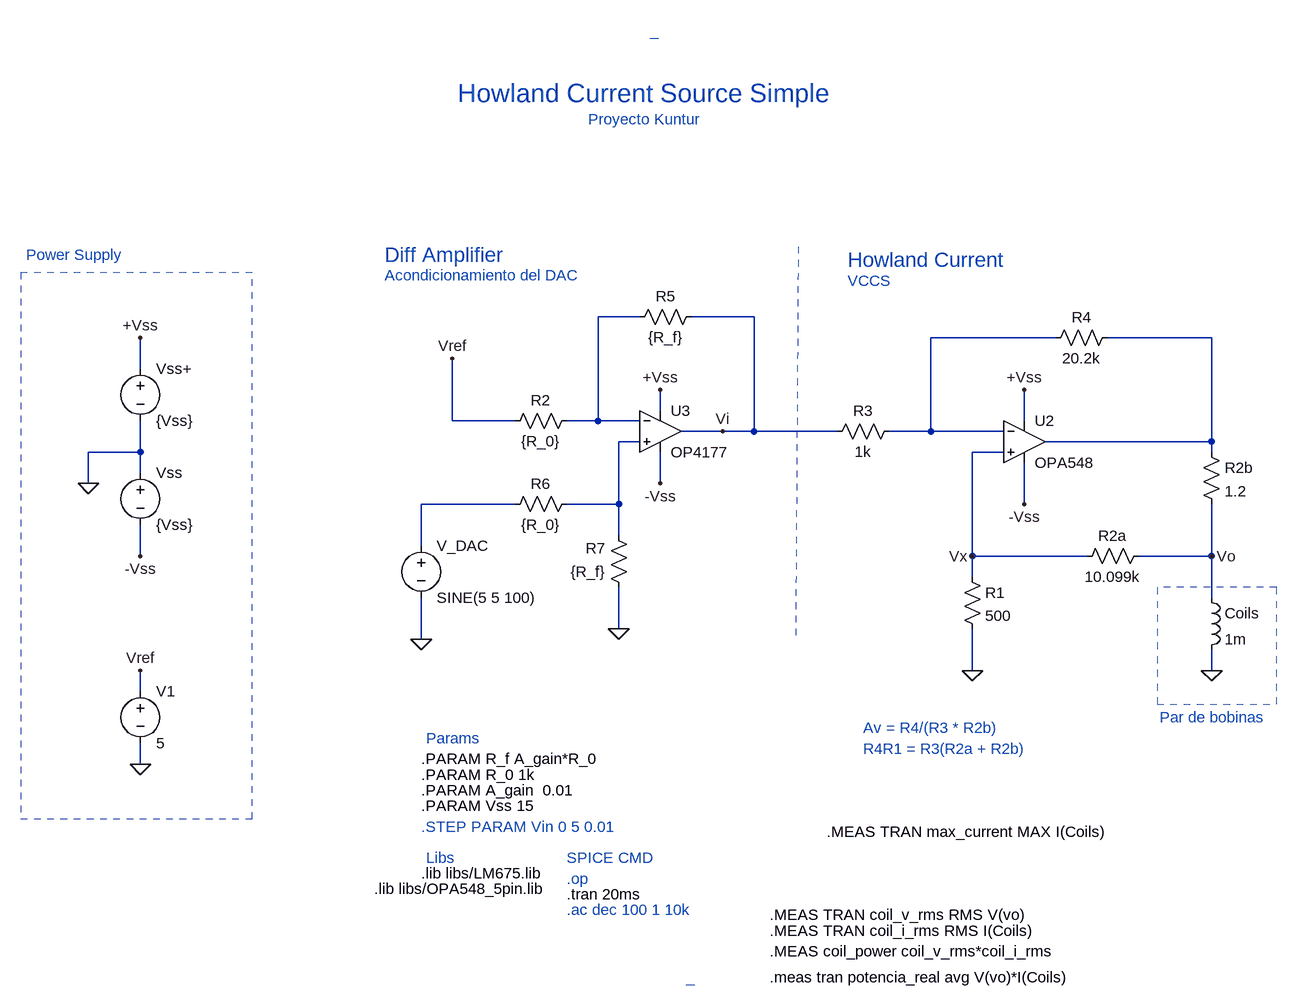
[diagram p0: schematic howland_cs.asc]
howland_cs.asc, the LTspice schematic file:
Version 4
SHEET 1 888 1144
WIRE -96 64 -160 64
WIRE 80 64 -16 64
WIRE 544 96 352 96
WIRE 784 96 624 96
WIRE -864 144 -864 96
WIRE -64 208 -64 176
WIRE -384 224 -384 128
WIRE -288 224 -384 224
WIRE -160 224 -160 64
WIRE -160 224 -208 224
WIRE -96 224 -160 224
WIRE 496 224 496 176
WIRE 32 240 -32 240
WIRE 80 240 80 64
WIRE 80 240 32 240
WIRE 208 240 80 240
WIRE 352 240 352 96
WIRE 352 240 288 240
WIRE 464 240 352 240
WIRE -96 256 -128 256
WIRE 784 256 784 96
WIRE 784 256 528 256
WIRE -864 272 -864 224
WIRE -864 272 -944 272
WIRE 464 272 416 272
WIRE 784 272 784 256
WIRE -864 304 -864 272
WIRE -944 320 -944 272
WIRE -64 320 -64 272
WIRE -288 352 -432 352
WIRE -128 352 -128 256
WIRE -128 352 -208 352
WIRE 496 352 496 288
WIRE -128 400 -128 352
WIRE -432 416 -432 352
WIRE -864 432 -864 384
WIRE 416 432 416 272
WIRE 592 432 416 432
WIRE 784 432 784 352
WIRE 784 432 672 432
WIRE 416 464 416 432
WIRE 784 496 784 432
WIRE -128 544 -128 480
WIRE -432 560 -432 496
WIRE 416 608 416 544
WIRE 784 608 784 576
WIRE -864 640 -864 608
WIRE -864 752 -864 720
FLAG -944 320 0
FLAG -864 432 -Vss
FLAG -864 96 +Vss
FLAG 496 176 +Vss
FLAG 496 352 -Vss
FLAG 416 608 0
FLAG 784 608 0
FLAG -864 752 0
FLAG -864 608 Vref
FLAG -128 544 0
FLAG -432 560 0
FLAG -384 128 Vref
FLAG -64 320 -Vss
FLAG -64 176 +Vss
FLAG 32 240 Vi
FLAG 416 432 Vx
FLAG 784 432 Vo
SYMBOL voltage -864 288 R0
SYMATTR InstName Vss
SYMATTR Value {Vss}
SYMBOL voltage -864 128 R0
SYMATTR InstName Vss+
SYMATTR Value {Vss}
SYMBOL Res 304 224 R90
WINDOW 0 0 56 VBottom 2
WINDOW 3 32 56 VTop 2
SYMATTR InstName R3
SYMATTR Value 1k
SYMBOL Res 640 80 R90
WINDOW 0 0 56 VBottom 2
WINDOW 3 32 56 VTop 2
SYMATTR InstName R4
SYMATTR Value 20.2k
SYMBOL Res 400 448 R0
SYMATTR InstName R1
SYMATTR Value 500
SYMBOL ind 768 480 R0
SYMATTR InstName Coils
SYMATTR Value 1m
SYMATTR SpiceLine Rser=10
SYMBOL Res 768 256 R0
SYMATTR InstName R2b
SYMATTR Value 1.2
SYMBOL Res 688 416 R90
WINDOW 0 0 56 VBottom 2
WINDOW 3 32 56 VTop 2
SYMATTR InstName R2a
SYMATTR Value 10.099k
SYMBOL OpAmps/opamp2 496 192 R0
SYMATTR InstName U2
SYMATTR Value OPA548
SYMATTR SpiceModel OPA548
SYMBOL Voltage -864 624 R0
SYMATTR InstName V1
SYMATTR Value 5
SYMBOL Res -192 208 R90
WINDOW 0 0 56 VBottom 2
WINDOW 3 32 56 VTop 2
SYMATTR InstName R2
SYMATTR Value {R_0}
SYMBOL Res 0 48 R90
WINDOW 0 0 56 VBottom 2
WINDOW 3 32 56 VTop 2
SYMATTR InstName R5
SYMATTR Value {R_f}
SYMBOL Res -192 336 R90
WINDOW 0 0 56 VBottom 2
WINDOW 3 32 56 VTop 2
SYMATTR InstName R6
SYMATTR Value {R_0}
SYMBOL Res -112 496 R180
WINDOW 0 36 76 Left 2
WINDOW 3 36 40 Left 2
SYMATTR InstName R7
SYMATTR Value {R_f}
SYMBOL Voltage -432 400 R0
SYMATTR InstName V_DAC
SYMATTR Value SINE(5 5 100)
SYMBOL OpAmps/OP4177 -64 176 R0
SYMATTR InstName U3
TEXT -208 928 Left 2 ;.op
TEXT -432 920 Left 2 !.lib libs/LM675.lib
TEXT -432 848 Left 2 ;.STEP PARAM Vin 0 5 0.01
TEXT -432 792 Left 2 !.PARAM A_gain  0.01
TEXT -432 768 Left 2 !.PARAM R_0 1k
TEXT -432 744 Left 2 !.PARAM R_f A_gain*R_0
TEXT -488 -32 Left 3 ;Diff Amplifier
TEXT -488 0 Left 2 ;Acondicionamiento del DAC
TEXT -88 -280 Center 4 ;Howland Current Source Simple
TEXT -88 -240 Center 2 ;Proyecto Kuntur
TEXT 224 -24 Left 3 ;Howland Current
TEXT 224 8 Left 2 ;VCCS
TEXT -24 1080 Left 2 ;_
TEXT -1040 -32 Left 2 ;Power Supply
TEXT -208 896 Left 2 ;SPICE CMD
TEXT -208 952 Left 2 !.tran 20ms
TEXT -424 712 Left 2 ;Params
TEXT -424 896 Left 2 ;Libs
TEXT -80 -376 Left 2 ;_
TEXT 704 680 Left 2 ;Par de bobinas
TEXT 248 696 Left 2 ;Av = R4/(R3 * R2b)
TEXT 248 728 Left 2 ;R4R1 = R3(R2a + R2b)
TEXT -432 816 Left 2 !.PARAM Vss 15
TEXT 192 856 Left 2 !.MEAS TRAN max_current MAX I(Coils)
TEXT 104 984 Left 2 !.MEAS TRAN coil_v_rms RMS V(vo)
TEXT 104 1008 Left 2 !.MEAS TRAN coil_i_rms RMS I(Coils)
TEXT 104 1040 Left 2 !.MEAS coil_power coil_v_rms*coil_i_rms
TEXT 104 1080 Left 2 !.meas tran potencia_real avg V(vo)*I(Coils)
TEXT -208 976 Left 2 ;.ac dec 100 1 10k
TEXT -504 944 Left 2 !.lib libs/OPA548_5pin.lib
LINE Normal 148 -44 144 564 2
RECTANGLE Normal -692 -4 -1048 836 2
RECTANGLE Normal 884 480 700 660 2

The netlist it stands for:
* howland_cs.asc
Vss 0 -Vss {Vss}
Vss+ +Vss 0 {Vss}
R3 N002 Vi 1k
R4 N003 N002 20.2k
R1 Vx 0 500
L§Coils Vo 0 1m Rser=10
R2b N003 Vo 1.2
R2a Vo Vx 10.099k
XU2 Vx N002 +Vss -Vss N003 OPA548 OPA548  ; pins In+ In- V+ V- OUT
V1 Vref 0 5
R2 N001 Vref {R_0}
R5 Vi N001 {R_f}
R6 N004 N005 {R_0}
R7 0 N004 {R_f}
V_DAC N005 0 SINE(5 5 100)
XU3 N004 N001 +Vss -Vss Vi OP4177  ; pins In+ In- V+ V- OUT
* .op
.lib libs/LM675.lib
* .STEP PARAM Vin 0 5 0.01
.PARAM A_gain  0.01
.PARAM R_0 1k
.PARAM R_f A_gain*R_0
* Diff Amplifier
* Acondicionamiento del DAC
* Howland Current Source Simple
* Proyecto Kuntur
* Howland Current
* VCCS
* _
* Power Supply
* SPICE CMD
.tran 20ms
* Params
* Libs
* _
* Par de bobinas
* Av = R4/(R3 * R2b)
* R4R1 = R3(R2a + R2b)
.PARAM Vss 15
.MEAS TRAN max_current MAX I(Coils)
.MEAS TRAN coil_v_rms RMS V(vo)
.MEAS TRAN coil_i_rms RMS I(Coils)
.MEAS coil_power coil_v_rms*coil_i_rms
.meas tran potencia_real avg V(vo)*I(Coils)
* .ac dec 100 1 10k
.lib libs/OPA548_5pin.lib
.backanno
.end